# Altium schematic sheet LoRa and Pico.SchDoc
size B; SheetNumber: 3; SheetTotal: 4
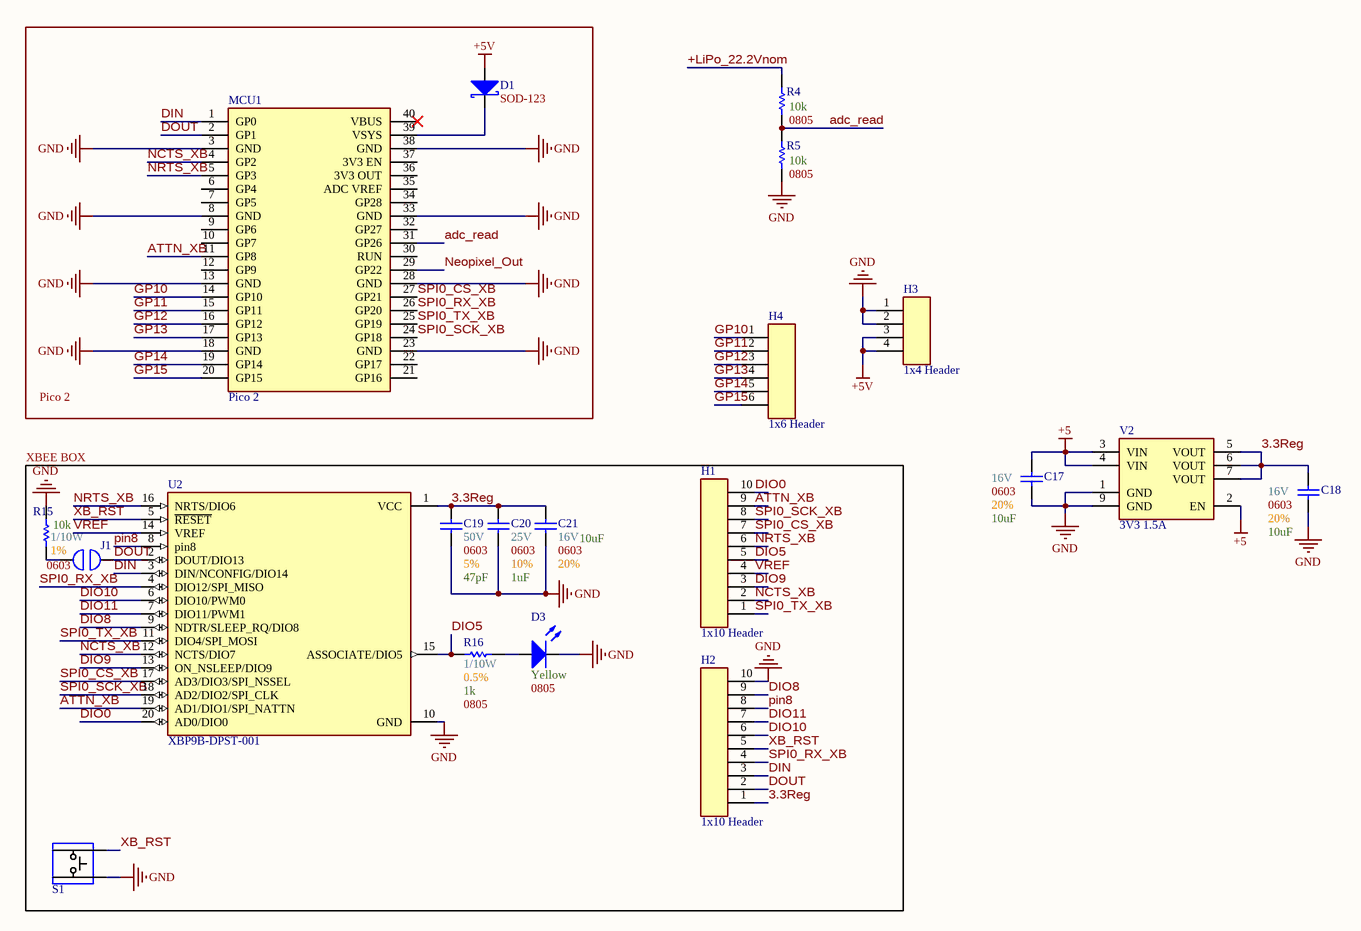
[diagram p0: LoRa and Pico.SchDoc]

## Parts
C17  Max Voltage: 16V  Size Package: 0603  Tolerance: 20%  Capacitance: 10uF  [[Cap] SMD 0603]  (hidden comment: [Cap] 0603 10uF 20% 16V)
C18  Max Voltage: 16V  Size Package: 0603  Tolerance: 20%  Capacitance: 10uF  [[Cap] SMD 0603]  (hidden comment: [Cap] 0603 10uF 20% 16V)
C19  Max Voltage: 50V  Size Package: 0603  Tolerance: 5%  Capacitance: 47pF  [[Cap] SMD 0603]  (hidden comment: [Cap] 0603 47pF 5% 50V)
C20  Max Voltage: 25V  Size Package: 0603  Tolerance: 10%  Capacitance: 1uF  [[Cap] SMD 0603]  (hidden comment: [Cap] 0603 1uF 10% 25V)
C21  Max Voltage: 16V  Size Package: 0603  Tolerance: 20%  Capacitance: 10uF  [[Cap] SMD 0603]  (hidden comment: [Cap] 0603 10uF 20% 16V)
D1  Footprint: SOD-123  [[Diode] SMD SOD-123]  (hidden comment: SOD123)
D3  Color: Yellow  Size Package: 0805  [[LED] SMD 0805]  (hidden comment: [LED] SMD 0805 Yellow)
H1  1x10 Header  [[Header] 1x10 Male]
H2  1x10 Header  [[Header] 1x10 Male]
H3  1x4 Header  [[Header] 1x4 Male]
H4  1x6 Header  [[Header] 1x6 Male]
J1  [Jumper] Thru-Hole 2pin  [[Jumper] Thru-Hole 2pin]  (value not drawn)
MCU1  Pico 2  [[Pi] Pico 2]
R4  Resistance: 10k  Size Package: 0805  [[Res] SMD 0805]  (hidden comment: [10k] SMD 0805 5% 1/8W)
R5  Resistance: 10k  Size Package: 0805  [[Res] SMD 0805]  (hidden comment: [10k] SMD 0805 5% 1/8W)
R15  Wattage: 1/10W  Tolerance: 1%  Resistance: 10k  Size Package: 0603  [[Res] SMD 0603]  (hidden comment: [10k] SMD 0603 1% 1/10W)
R16  Wattage: 1/10W  Tolerance: 0.5%  Resistance: 1k  Size Package: 0805  [[Res] SMD 0805]  (hidden comment: [1k] SMD 0805 0.5% 1/10W)
S1  Standard pushbutton  [[SPST] Pushbutton]  (value not drawn)
U2  XBP9B-DPST-001  [xbee]
V2  3V3 1.5A  [[Linear] 3V3 1.5A]

## Blocks framed on the sheet
Pico 2: D1 MCU1
XBEE BOX: C19-C21 D3 H1 H2 J1 R15 R16 S1 U2

## Nets
+5: C17.2 V2.2(EN) V2.3(VIN) V2.4(VIN)
+5V: D1.2(A) H3.3 H3.4
GND: C17.1 C18.1 C19.1 C20.1 C21.1 D3.2(Cathode) H2.10 H3.1 H3.2 MCU1.3(GND) MCU1.8(GND) MCU1.13(GND) MCU1.18(GND) MCU1.23(GND) MCU1.28(GND) MCU1.33(GND) MCU1.38(GND) R5.1 R15.1 S1.1 U2.10(GND) V2.1(GND) V2.9(GND)
3.3Reg: C18.2 C19.2 C20.2 C21.2 H2.1 U2.1(VCC) V2.5(VOUT) V2.6(VOUT) V2.7(VOUT)
+LiPo_22.2Vnom: R4.2
adc_read: MCU1.31(GP26) R4.1 R5.2
ATTN_XB: H1.9 MCU1.11(GP8) U2.19(AD1/DIO1/SPI_NATTN)
DIN: H2.3 MCU1.1(GP0) U2.3(DIN/NCONFIG/DIO14)
DIO0: H1.10 U2.20(AD0/DIO0)
DIO5: H1.5 R16.1 U2.15(ASSOCIATE/DIO5)
DIO8: H2.9 U2.9(NDTR/SLEEP_RQ/DIO8)
DIO9: H1.3 U2.13(ON_NSLEEP/DIO9)
DIO10: H2.6 U2.6(DIO10/PWM0)
DIO11: H2.7 U2.7(DIO11/PWM1)
DOUT: H2.2 J1.2 MCU1.2(GP1) U2.2(DOUT/DIO13)
GP10: H4.1 MCU1.14(GP10)
GP11: H4.2 MCU1.15(GP11)
GP12: H4.3 MCU1.16(GP12)
GP13: H4.4 MCU1.17(GP13)
GP14: H4.5 MCU1.19(GP14)
GP15: H4.6 MCU1.20(GP15)
NCTS_XB: H1.2 MCU1.4(GP2) U2.12(NCTS/DIO7)
Neopixel_Out: MCU1.29(GP22)
NRTS_XB: H1.6 MCU1.5(GP3) U2.16(NRTS/DIO6)
pin8: H2.8 U2.8(pin8)
SPI0_CS_XB: H1.7 MCU1.27(GP21) U2.17(AD3/DIO3/SPI_NSSEL)
SPI0_RX_XB: H2.4 MCU1.26(GP20) U2.4(DIO12/SPI_MISO)
SPI0_SCK_XB: H1.8 MCU1.24(GP18) U2.18(AD2/DIO2/SPI_CLK)
SPI0_TX_XB: H1.1 MCU1.25(GP19) U2.11(DIO4/SPI_MOSI)
VREF: H1.4 U2.14(VREF)
XB_RST: H2.5 S1.2 U2.5(~{RESET})
NetD1_1: D1.1(K) MCU1.39(VSYS)
NetD3_1: D3.1(Anode) R16.2
NetJ1_1: J1.1 R15.2

Not connected (* = marked no-connect by the designer): MCU1 6(GP4) 7(GP5) 9(GP6) 10(GP7) 12(GP9) 21(GP16) 22(GP17) 30(RUN) 32(GP27) 34(GP28) 35(ADC_VREF) 36(3V3_OUT) 37(3V3_EN) 40(VBUS)*

## Library data of the parts
C17 C18 C21 = [Cap] 0603 10uF 20% 16V: GRM188C81C106MA73D; Supplier 1: DigiKey; Supplier Part Number 1: 490-7198-1-ND
C19 = [Cap] 0603 47pF 5% 50V: CL10C470JB8NNNC; Supplier 1: DigiKey; Supplier Part Number 1: 1276-1037-6-ND
C20 = [Cap] 0603 1uF 10% 25V: CL10B105KA8NNNC; Supplier 1: DigiKey; Supplier Part Number 1: 1276-1184-1-ND
D1 = [Schottky] SMD 40V 1A: B5819W-TP; Supplier 1: DigiKey; Supplier Part Number 1: B5819W-TPMSCT-ND
D3 = [LED] SMD 0805 Yellow: LY R976-PS-36-0-20-R18; Supplier 1: DigiKey; Supplier Part Number 1: 475-LYR976-PS-36-0-20-R18CT-ND
H1 H2 = [Header] 1x10 Male: 2.54mm pitch
H3 = [Header] 1x4 Male: 2.54mm pitch
H4 = [Header] 1x6 Male: 2.54mm pitch
MCU1 = [Pi] Pico 2: SC1631; Supplier 1: DigiKey; Supplier Part Number 1: 2648-SC1631TR-ND
R4 R5 = [10k] SMD 0805 5% 1/8W: RC0603FR-0710KL; Wattage: 1/10W; Supplier 1: DigiKey; Supplier Part Number 1: 311-10.0KHRDKR-ND; Tolerance: 5%
R15 = [10k] SMD 0603 1% 1/10W: RMCF0603FT10K0; Supplier 1: DigiKey; Supplier Part Number 1: RMCF0603FT10K0DKR-ND
R16 = [1k] SMD 0805 0.5% 1/10W: RR1220P-102-D; Supplier 1: DigiKey; Supplier Part Number 1: RR12P1.0KDCT-ND
S1 = [SPST] Pushbutton: Supplier 1: DigiKey; Supplier Part Number 1: 450-1650-ND
U2 = XBP9B-DPST-001: General ISM < 1GHz Transceiver Module 900MHz Antenna Not Included, RP-SMA Through Hole
V2 = [Linear] SMD 3V3 1.5A: AP7362A-33SP-13; Supplier 1: DigiKey; Supplier Part Number 1: AP7362A-33SP-13DICT-ND